# Altium project Power_Board.PrjPcb
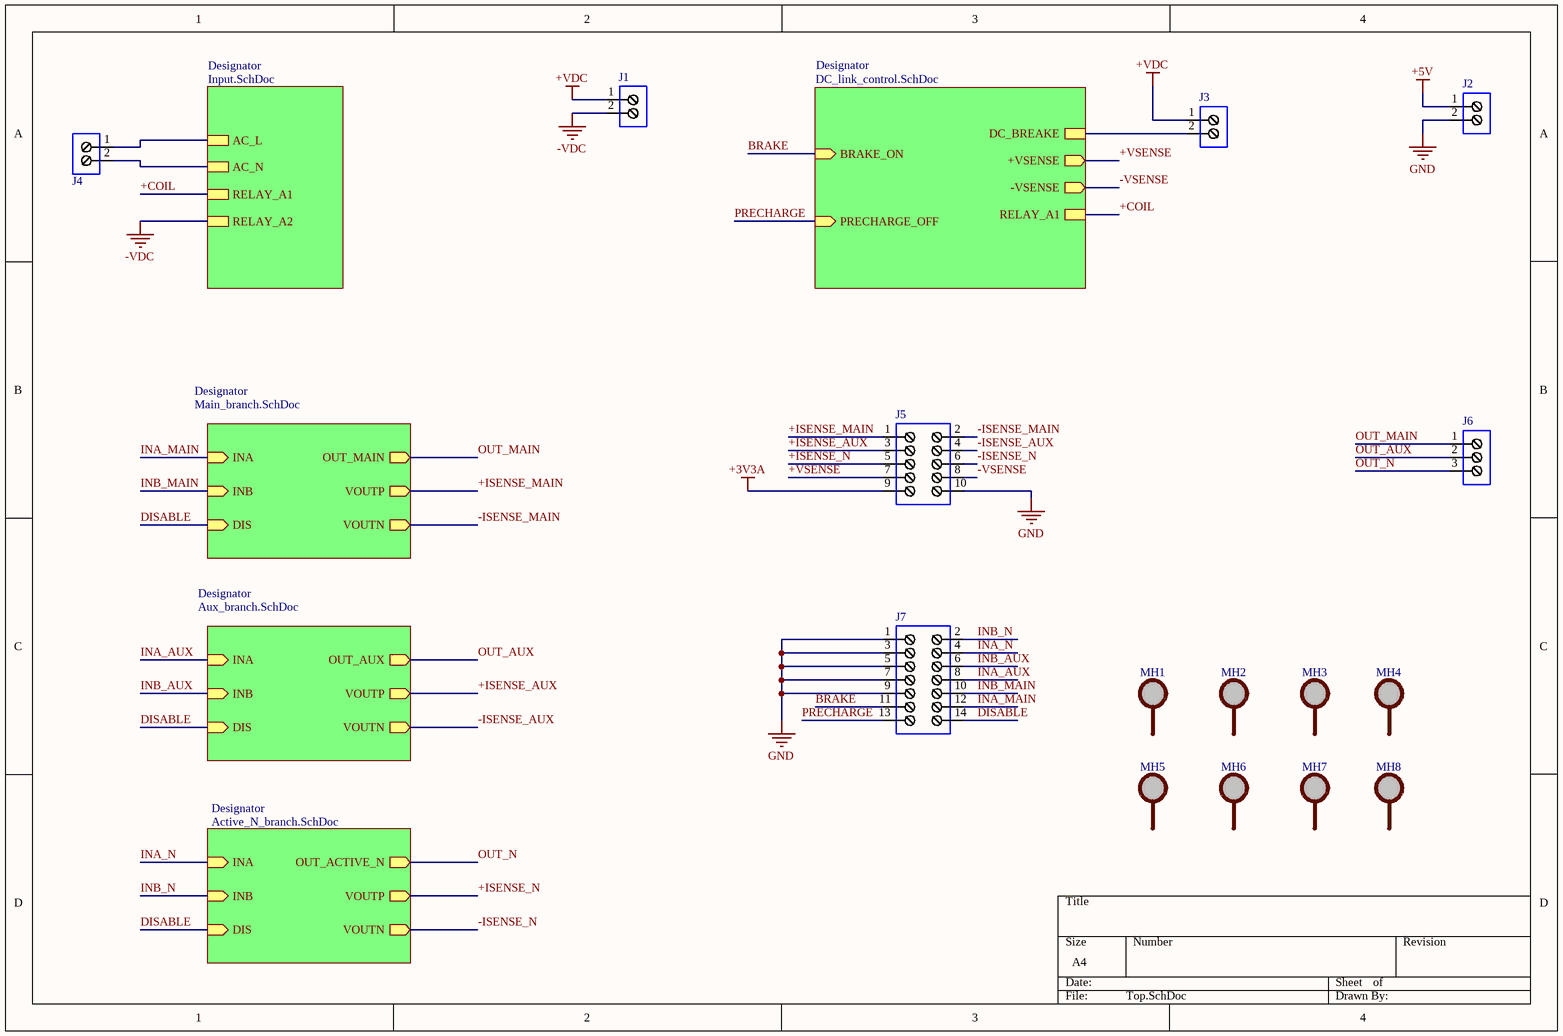
[diagram p0: Top.SchDoc]
6 sheets, 209 parts. Net scope: hierarchical (ports join the sheet entries above them; power ports are global).
Board file: Power_Board.PcbDoc
Sheets:
  Top.SchDoc
    Designator = Main_branch.SchDoc
    Designator = DC_link_control.SchDoc
    Designator = Aux_branch.SchDoc
    Designator = Input.SchDoc
    Designator = Active_N_branch.SchDoc

## Sheet Top.SchDoc
size A4; SheetNumber: 1; SheetTotal: 6

### Parts
J1  MKDSN1.5/2  [1729018]  (value not drawn)
J2  JST_B2B-XH-A_(LF)(SN)  [JST_B2B-XH-A_(LF)(SN)]  (value not drawn)
J3  MKDSN1.5/2  [1729018]  (value not drawn)
J4  MKDSN1.5/2  [1729018]  (value not drawn)
J5  DS1013-10SSIB1-B-0  [DS1013-10SSIB1-B-0]  (value not drawn)
J6  MKDSN 1,5/ 3-5,08  [1729131]  (value not drawn)
J7  DS1013-14SSIBG  [DS1013-14SSIBG]  (value not drawn)
MH1  Mounting Hole  [M3 mounting hole]  (value not drawn)
MH2  Mounting Hole  [M3 mounting hole]  (value not drawn)
MH3  Mounting Hole  [M3 mounting hole]  (value not drawn)
MH4  Mounting Hole  [M3 mounting hole]  (value not drawn)
MH5  Mounting Hole  [M3 mounting hole]  (value not drawn)
MH6  Mounting Hole  [M3 mounting hole]  (value not drawn)
MH7  Mounting Hole  [M3 mounting hole]  (value not drawn)
MH8  Mounting Hole  [M3 mounting hole]  (value not drawn)

### Sub-sheets
Designator = Main_branch.SchDoc: OUT_MAIN (out), VOUTP (out), VOUTN (out), INB (in), INA (in), DIS (in)
Designator = DC_link_control.SchDoc: DC_BREAKE, +VSENSE (out), -VSENSE (out), BRAKE_ON (in), PRECHARGE_OFF (in), RELAY_A1
Designator = Aux_branch.SchDoc: INB (in), INA (in), DIS (in), OUT_AUX (out), VOUTP (out), VOUTN (out)
Designator = Input.SchDoc: AC_L, AC_N, RELAY_A2, RELAY_A1
Designator = Active_N_branch.SchDoc: INB (in), INA (in), DIS (in), OUT_ACTIVE_N (out), VOUTP (out), VOUTN (out)

### Nets
+3V3A: J5.9
+5V: J2.1
+VDC: J1.1 J3.1
-VDC: J1.2 ; sheet Designator/RELAY_A2
GND: J2.2 J5.10 J7.1 J7.3 J7.5 J7.7 J7.9
+COIL: sheet Designator/RELAY_A1, sheet Designator/RELAY_A1
+ISENSE_AUX: J5.3 ; sheet Designator/VOUTP
+ISENSE_MAIN: J5.1 ; sheet Designator/VOUTP
+ISENSE_N: J5.5 ; sheet Designator/VOUTP
+VSENSE: J5.7 ; sheet Designator/+VSENSE
-ISENSE_AUX: J5.4 ; sheet Designator/VOUTN
-ISENSE_MAIN: J5.2 ; sheet Designator/VOUTN
-ISENSE_N: J5.6 ; sheet Designator/VOUTN
-VSENSE: J5.8 ; sheet Designator/-VSENSE
AC_N: J4.2 ; sheet Designator/AC_N
BRAKE: J7.11 ; sheet Designator/BRAKE_ON
DISABLE: J7.14 ; sheet Designator/DIS, sheet Designator/DIS, sheet Designator/DIS
INA_AUX: J7.8 ; sheet Designator/INA
INA_MAIN: J7.12 ; sheet Designator/INA
INA_N: J7.4 ; sheet Designator/INA
INB_AUX: J7.6 ; sheet Designator/INB
INB_MAIN: J7.10 ; sheet Designator/INB
INB_N: J7.2 ; sheet Designator/INB
OUT_AUX: J6.2 ; sheet Designator/OUT_AUX
OUT_MAIN: J6.1 ; sheet Designator/OUT_MAIN
OUT_N: J6.3 ; sheet Designator/OUT_ACTIVE_N
PRECHARGE: J7.13 ; sheet Designator/PRECHARGE_OFF
NetF1_1: J4.1 ; sheet Designator/AC_L
NetJ3_2: J3.2 ; sheet Designator/DC_BREAKE

### Library data of the parts
J1 J3 J4 = 1729018: Connector: PCB terminal block; 17.5A; 400V; PIN: 2; screw terminal
J2 = JST_B2B-XH-A_(LF)(SN): Connector: wire-board; XH; socket; male; data; 3A; 250V; PIN: 2; 2.5mm
J5 = DS1013-10SSIB1-B-0: Connector: IDC; socket; male; PIN: 10; straight; THT; 2.54mm; 2x5
J6 = 1729131: Connector: PCB terminal block; 17.5A; 400V; PIN: 3; screw terminal
J7 = DS1013-14SSIBG: Connector: IDC; socket; male; data; PIN: 14; straight; THT; 2.54mm
MH1-MH8 = M3_mounting_hole

## Sheet Main_branch.SchDoc
size A4; SheetNumber: 2; SheetTotal: 6
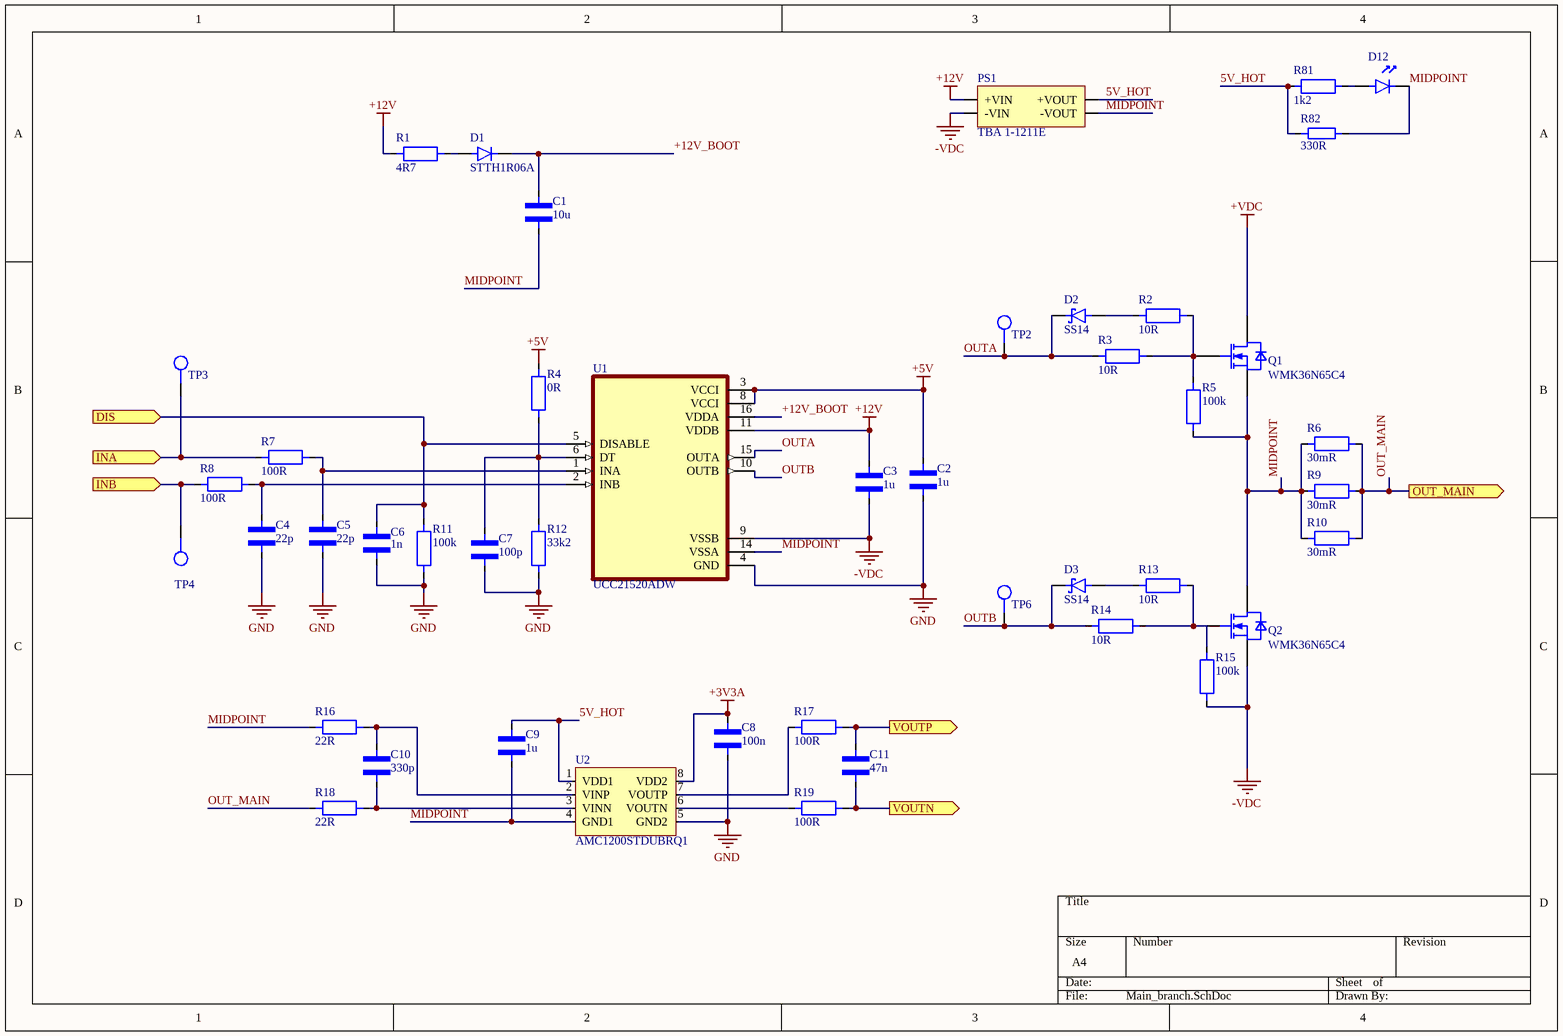
[diagram p1: Main_branch.SchDoc]

### Parts
C1  10u  [CAPACITOR_1206]
C2  1u  [Capacitor_0805]
C3  1u  [Capacitor_0805]
C4  22p  [Capacitor_0805]
C5  22p  [Capacitor_0805]
C6  1n  [Capacitor_0805]
C7  100p  [Capacitor_0805]
C8  100n  [Capacitor_0805]
C9  1u  [Capacitor_0805]
C10  330p  [Capacitor_0805]
C11  47n  [Capacitor_0805]
D1  STTH1R06A  [STTH1R06A]
D2  SS14  [DIOM5226X230N]
D3  SS14  [DIOM5226X230N]
D12  LTST-C171KRKT  [LTST-C171K]  (value not drawn)
PS1  TBA 1-1211E  [TBA 1-1211E]
Q1  WMK36N65C4  [TO220-3]
Q2  WMK36N65C4  [TO220-3]
R1  4R7  [RESISTOR_1206]
R2  10R  [RESISTOR_0805]
R3  10R  [RESISTOR_0805]
R4  0R  [RESISTOR_0805]
R5  100k  [RESISTOR_0805]
R6  30mR  [MAR251203FR030S]
R7  100R  [RESISTOR_0805]
R8  100R  [RESISTOR_0805]
R9  30mR  [MAR251203FR030S]
R10  30mR  [MAR251203FR030S]
R11  100k  [RESISTOR_0805]
R12  33k2  [RESISTOR_0805]
R13  10R  [RESISTOR_0805]
R14  10R  [RESISTOR_0805]
R15  100k  [RESISTOR_0805]
R16  22R  [RESISTOR_0805]
R17  100R  [RESISTOR_0805]
R18  22R  [RESISTOR_0805]
R19  100R  [RESISTOR_0805]
R81  1k2  [RESISTOR_0805]
R82  330R  [RESISTOR_1206]
TP2  TestPoint  [TestPoint_1.5mm]  (value not drawn)
TP3  TestPoint  [TestPoint_1.5mm]  (value not drawn)
TP4  TestPoint  [TestPoint_1.5mm]  (value not drawn)
TP6  TestPoint  [TestPoint_1.5mm]  (value not drawn)
U1  UCC21520ADW  [UCC21520ADW]
U2  AMC1200STDUBRQ1  [SOP254P1040X485-8N]

### Ports
DIS (in), INA (in), INB (in), OUT_MAIN (out), VOUTN (out), VOUTP (out)

### Nets
+3V3A: C8.2 U2.8(VDD2)
+5V: C2.1 R4.2 U1.3(VCCI) U1.8(VCCI)
+12V: C3.2 PS1.1(+VIN) R1.1 U1.11(VDDB)
+VDC: Q1.2(DRAIN)
-VDC: C3.1 PS1.2(-VIN) Q2.3(SOURCE) R15.1 U1.9(VSSB)
GND: C2.2 C4.1 C5.1 C6.1 C7.1 C8.1 R11.1 R12.1 U1.4(GND) U2.5(GND2)
5V_HOT: C9.2 PS1.4(+VOUT) R81.1 R82.1 U2.1(VDD1)  [project net 5V_HOT_2]
+12V_BOOT: C1.1 D1.2(K) U1.16(VDDA)  [project net +12V_BOOT_2]
+ISENSE_MAIN: C11.2 R17.2 ; port VOUTP
-ISENSE_MAIN: C11.1 R19.2 ; port VOUTN
DISABLE: C6.2 R11.2 U1.5(DISABLE) ; port DIS
INA_MAIN: R7.1 TP3.1 ; port INA
INB_MAIN: R8.1 TP4.1 ; port INB
MIDPOINT: C1.2 C9.1 D12.2(K) PS1.3(-VOUT) Q1.3(SOURCE) Q2.2(DRAIN) R5.1 R6.1 R9.1 R10.1 R16.1 R82.2 U1.14(VSSA) U2.4(GND1)  [project net MIDPOINT_2]
OUT_MAIN: R6.2 R9.2 R10.2 R18.1 ; port OUT_MAIN
OUTA: D2.2(K) R3.1 TP2.1 U1.15(OUTA)  [project net OUTA_2]
OUTB: D3.2(K) R14.1 TP6.1 U1.10(OUTB)  [project net OUTB_2]
NetC4_2: C4.2 R8.2 U1.2(INB)
NetC5_2: C5.2 R7.2 U1.1(INA)
NetC7_2: C7.2 R4.1 R12.2 U1.6(DT)
NetC10_1: C10.1 R18.2 U2.3(VINN)
NetC10_2: C10.2 R16.2 U2.2(VINP)
NetD1_1: D1.1(A) R1.2
NetD2_1: D2.1(A) R2.1
NetD3_1: D3.1(A) R13.1
NetD12_1: D12.1(A) R81.2
NetQ1_1: Q1.1(GATE) R2.2 R3.2 R5.2
NetQ2_1: Q2.1(GATE) R13.2 R14.2 R15.2
NetR17_1: R17.1 U2.7(VOUTP)
NetR19_1: R19.1 U2.6(VOUTN)

### Library data of the parts
C1 = CAPACITOR_1206: MLCC capacitor in 1206 package
C2-C11 = CAPACITOR_0805: MLCC capacitor in 0805 package
D1 = STTH1R06A: Diode: rectifying; SMD; 600V; 1A; 25ns; SMA; Ufmax: 1V; Ifsm: 20A
D2 D3 = SS14: 1A, 40V, Schottky Rectifier; MF: Taiwan Semiconductor; SnapEDA_Link: https://www.snapeda.com/parts/SS14/taiwan/view-part/?ref=snap; Package: SMA-2 Taiwan Semiconductor; MP: SS14; Check_prices: https://www.snapeda.com/parts/SS14/taiwan/view-part/?ref=eda
D12 = LTST-C171KRKT: LED; red; SMD; 0805; 18÷54mcd; 2÷2.4VDC; 2x1.25x0.8mm; 130°; 20mA
PS1 = TBA 1-1211E: Converter: DC/DC; 1W; Uin: 10.8÷13.2VDC; Uout: 5VDC; Iout: 200mA; pin to pad: 3>4 4>6
Q1 Q2 = WMK36N65C4: Transistor: N-MOSFET; WMOS™ C4; unipolar; 650V; 20A; Idm: 100A; 277W; Manufacturer: WAYON; ManufacturerPartNumber: WMK36N65C4; PackageReference: PG-TO220
R1 R82 = RESISTOR_1206: SMD resistor in 1206 package
R2-R5 R7 R8 R13-R19 R81 = RESISTOR_0805: SMD resistor in 0805 package
  R7: Value: 100R
R6 R9 R10 = MAR251203FR030S: Resistor: thick film; 30mΩ; sensing; SMD; 2512; 3W; ±1%; -55÷170°C; Manufacturer: Wayon; Value: 30mR; ComponentLink1Description: TME; ComponentLink1URL: https://www.tme.eu/pl/details/mar251203fr010s/rezystory-smd/wayon/; Power: 3W; Tolerance: 1%
R11 R12 = RESISTOR_0805: SMD resistor in 0805 package; Value: 100R
U1 = UCC21520ADW: 5.7kVrms, 4A/6A dual-channel isolated gate driver w/ dual input, disable pin, 8V UVLO in DW package; MF: Texas Instruments; SnapEDA_Link: https://www.snapeda.com/parts/UCC21520ADW/Texas+Instruments/view-part/?ref=snap; Package: SOIC-16 Texas Instruments; Value: *; MP: UCC21520ADW; Check_prices: https://www.snapeda.com/parts/UCC21520ADW/Texas+Instruments/view-part/?ref=eda
U2 = AMC1200: AMC1200/B Fully-Differential Isolation Amplifier; Manufacturer: Texas Instruments

## Sheet DC_link_control.SchDoc
size A4; SheetNumber: 6; SheetTotal: 6
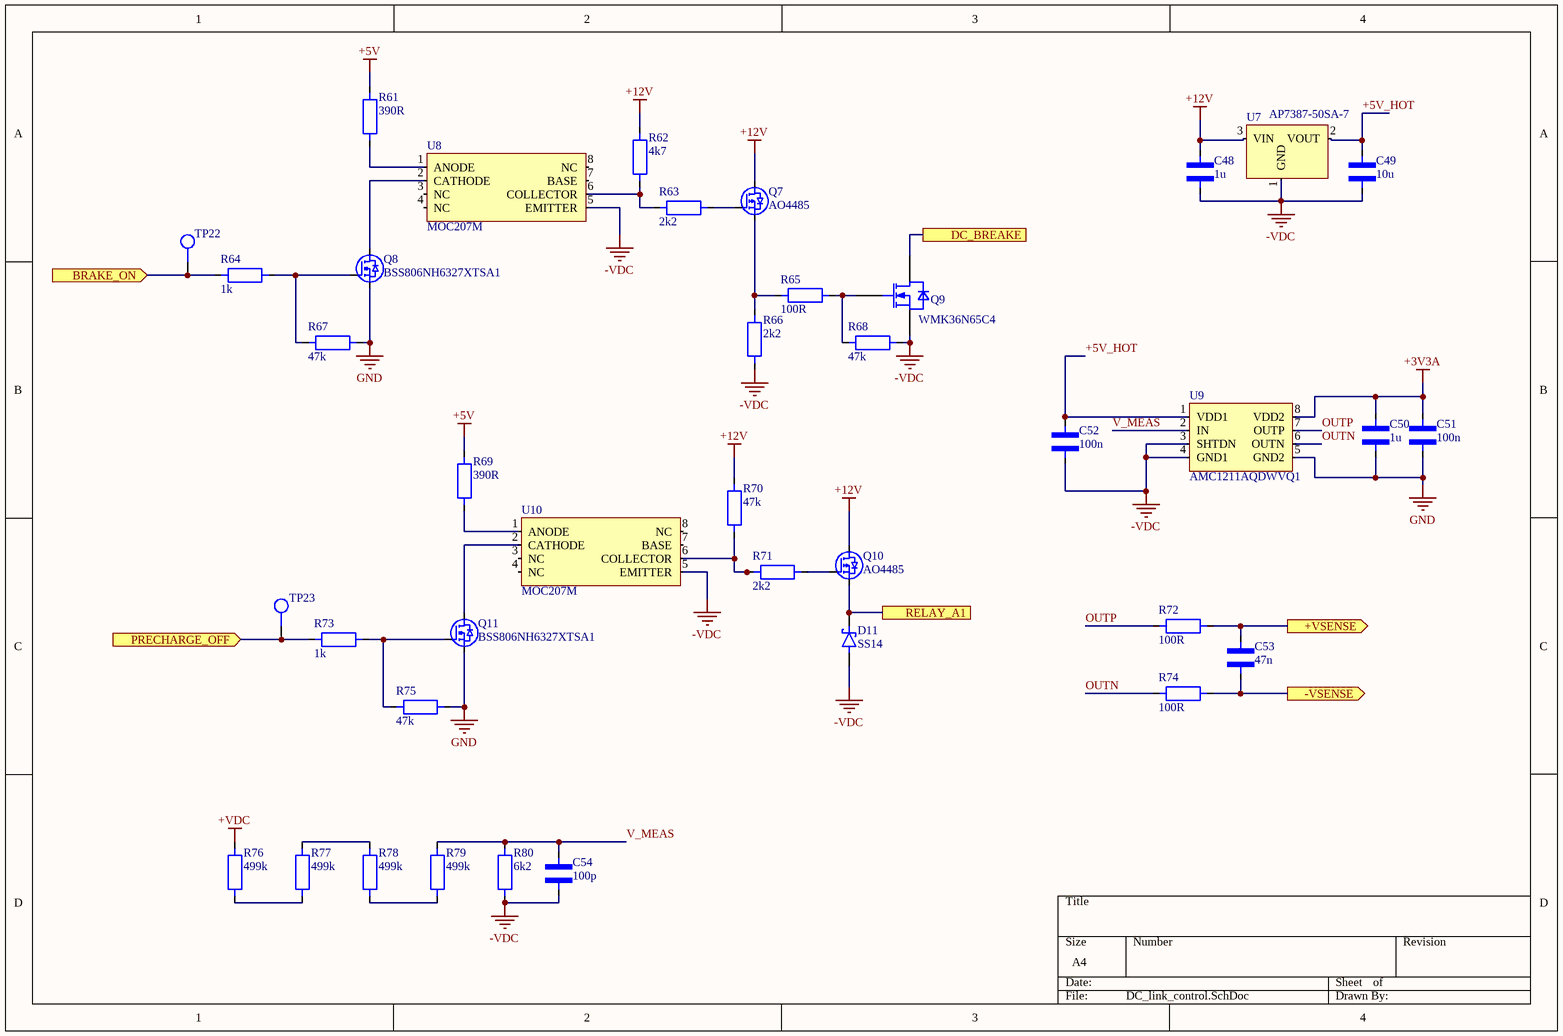
[diagram p2: DC_link_control.SchDoc]

### Parts
C48  1u  [Capacitor_0805]
C49  10u  [Capacitor_0805]
C50  1u  [Capacitor_0805]
C51  100n  [Capacitor_0805]
C52  100n  [Capacitor_0805]
C53  47n  [Capacitor_0805]
C54  100p  [Capacitor_0805]
D11  SS14  [DIOM5226X230N]
Q7  AO4485  [AO4485]
Q8  BSS806NH6327XTSA1  [BSS806NH6327XTSA1]
Q9  WMK36N65C4  [TO220-3]
Q10  AO4485  [AO4485]
Q11  BSS806NH6327XTSA1  [BSS806NH6327XTSA1]
R61  390R  [RESISTOR_0805]
R62  4k7  [RESISTOR_0805]
R63  2k2  [RESISTOR_0805]
R64  1k  [RESISTOR_0805]
R65  100R  [RESISTOR_0805]
R66  2k2  [RESISTOR_0805]
R67  47k  [RESISTOR_0805]
R68  47k  [RESISTOR_0805]
R69  390R  [RESISTOR_0805]
R70  47k  [RESISTOR_0805]
R71  2k2  [RESISTOR_0805]
R72  100R  [RESISTOR_0805]
R73  1k  [RESISTOR_0805]
R74  100R  [RESISTOR_0805]
R75  47k  [RESISTOR_0805]
R76  499k  [RESISTOR_1206]
R77  499k  [RESISTOR_1206]
R78  499k  [RESISTOR_1206]
R79  499k  [RESISTOR_1206]
R80  6k2  [RESISTOR_0805]
TP22  TestPoint  [TestPoint_1.5mm]  (value not drawn)
TP23  TestPoint  [TestPoint_1.5mm]  (value not drawn)
U7  AP7387-50SA-7  [SOT90P240X110-3N]
U8  MOC207M  [SOIC127P590X363-8N]
U9  AMC1211AQDWVQ1  [SOIC127P1150X275-8N]
U10  MOC207M  [SOIC127P590X363-8N]

### Ports
+VSENSE (out), -VSENSE (out), BRAKE_ON (in), DC_BREAKE, PRECHARGE_OFF (in), RELAY_A1

### Nets
+3V3A: C50.2 C51.2 U9.8(VDD2)
+5V: R61.2 R69.2
+12V: C48.2 Q7.2(D) Q10.2(D) R62.2 R70.2 U7.3(VIN)
+VDC: R76.2
-VDC: C48.1 C49.1 C52.1 C54.1 D11.1(A) Q9.3(SOURCE) R66.2 R68.2 R80.1 U7.1(GND) U8.5(EMITTER) U9.3(SHTDN) U9.4(GND1) U10.5(EMITTER)
GND: C50.1 C51.1 Q8.3(S) Q11.3(S) R67.1 R75.1 U9.5(GND2)
+5V_HOT: C49.2 C52.2 U7.2(VOUT) U9.1(VDD1)  [project net +5V_HOT_6]
+COIL: D11.2(K) Q10.3(S) ; port RELAY_A1
+VSENSE: C53.2 R72.2 ; port +VSENSE
-VSENSE: C53.1 R74.2 ; port -VSENSE
BRAKE: R64.1 TP22.1 ; port BRAKE_ON
OUTN: R74.1 U9.6(OUTN)  [project net OUTN_6]
OUTP: R72.1 U9.7(OUTP)  [project net OUTP_6]
PRECHARGE: R73.1 TP23.1 ; port PRECHARGE_OFF
V_MEAS: C54.2 R79.2 R80.2 U9.2(IN)  [project net V_MEAS_6]
NetJ3_2: Q9.2(DRAIN) ; port DC_BREAKE
NetQ7_1: Q7.1(G) R63.1
NetQ7_3: Q7.3(S) R65.2 R66.1
NetQ8_1: Q8.1(G) R64.2 R67.2
NetQ8_2: Q8.2(D) U8.2(CATHODE)
NetQ9_1: Q9.1(GATE) R65.1 R68.1
NetQ10_1: Q10.1(G) R71.1
NetQ11_1: Q11.1(G) R73.2 R75.2
NetQ11_2: Q11.2(D) U10.2(CATHODE)
NetR61_1: R61.1 U8.1(ANODE)
NetR62_1: R62.1 R63.2 U8.6(COLLECTOR)
NetR69_1: R69.1 U10.1(ANODE)
NetR70_1: R70.1 R71.2 U10.6(COLLECTOR)
NetR76_1: R76.1 R77.1
NetR77_2: R77.2 R78.2
NetR78_1: R78.1 R79.1

Not connected (* = marked no-connect by the designer): U8 3(NC) 4(NC) 7(BASE) 8(NC); U10 3(NC) 4(NC) 7(BASE) 8(NC)

### Library data of the parts
C48-C54 = CAPACITOR_0805: MLCC capacitor in 0805 package
D11 = SS14: as D2 on sheet Main_branch; SnapEDA_Link: https://www.snapeda.com/parts/SS14/taiwan/view-part/?ref=snap; Package: SMA-2 Taiwan Semiconductor; MP: SS14; Check_prices: https://www.snapeda.com/parts/SS14/taiwan/view-part/?ref=eda
Q7 Q10 = AO4485: Transistor: P-MOSFET; unipolar; -40V; -8A; 1.1W; SO8; pin to pad: 1>4 2>5+6+7+8 3>1+2+3
Q8 Q11 = BSS806NH6327XTSA1: Transistor: N-MOSFET; unipolar; 20V; 2.3A; 0.5W; SOT23
Q9 = WMK36N65C4: as Q1 on sheet Main_branch; ManufacturerPartNumber: WMK36N65C4; PackageReference: PG-TO220
R61-R75 = RESISTOR_0805: SMD resistor in 0805 package
R76-R79 = RESISTOR_1206: SMD resistor in 1206 package
R80 = RESISTOR_0805: SMD resistor in 0805 package; Tolerance: 0,1%
U7 = AP7387: WIDE INPUT VOLTAGE RANGE, 150mA ULDO REGULATOR; Manufacturer: Diodes Incorporated; Vout: 5V; Iout: 150mA
U8 U10 = MOC207M: 8-pin SOIC Single-Channel Phototransistor Output Optocoupler; Manufacturer: ONSEMI/Fairchild; Isolation voltage: 2,5kV; CTR: 100-200%; Vce: 30V; ton: 3,2us; toff: 4,7us
U9 = AMC1211: AMC1211-Q1 Automotive, High-Impedance, 2-V Input, Basic Isolated Amplifier; Manufacturer: Texas Instruments

## Sheet Aux_branch.SchDoc
size A4; SheetNumber: 4; SheetTotal: 6
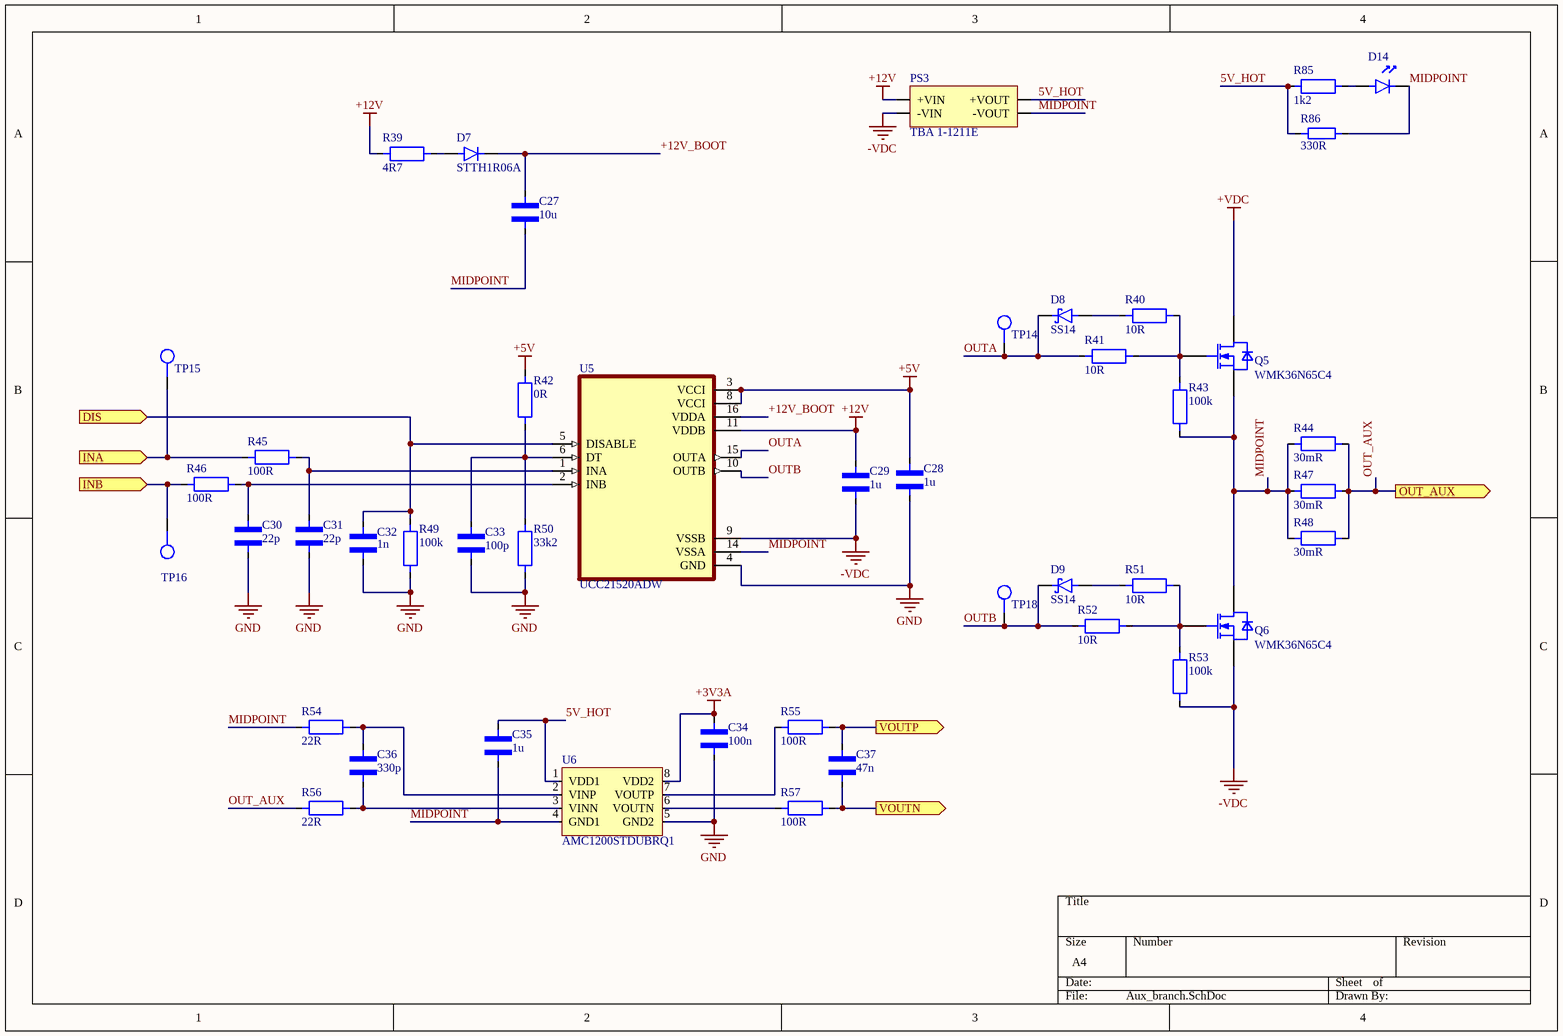
[diagram p3: Aux_branch.SchDoc]

### Parts
C27  10u  [CAPACITOR_1206]
C28  1u  [Capacitor_0805]
C29  1u  [Capacitor_0805]
C30  22p  [Capacitor_0805]
C31  22p  [Capacitor_0805]
C32  1n  [Capacitor_0805]
C33  100p  [Capacitor_0805]
C34  100n  [Capacitor_0805]
C35  1u  [Capacitor_0805]
C36  330p  [Capacitor_0805]
C37  47n  [Capacitor_0805]
D7  STTH1R06A  [STTH1R06A]
D8  SS14  [DIOM5226X230N]
D9  SS14  [DIOM5226X230N]
D14  LTST-C171KRKT  [LTST-C171K]  (value not drawn)
PS3  TBA 1-1211E  [TBA 1-1211E]
Q5  WMK36N65C4  [TO220-3]
Q6  WMK36N65C4  [TO220-3]
R39  4R7  [RESISTOR_1206]
R40  10R  [RESISTOR_0805]
R41  10R  [RESISTOR_0805]
R42  0R  [RESISTOR_0805]
R43  100k  [RESISTOR_0805]
R44  30mR  [MAR251203FR030S]
R45  100R  [RESISTOR_0805]
R46  100R  [RESISTOR_0805]
R47  30mR  [MAR251203FR030S]
R48  30mR  [MAR251203FR030S]
R49  100k  [RESISTOR_0805]
R50  33k2  [RESISTOR_0805]
R51  10R  [RESISTOR_0805]
R52  10R  [RESISTOR_0805]
R53  100k  [RESISTOR_0805]
R54  22R  [RESISTOR_0805]
R55  100R  [RESISTOR_0805]
R56  22R  [RESISTOR_0805]
R57  100R  [RESISTOR_0805]
R85  1k2  [RESISTOR_0805]
R86  330R  [RESISTOR_1206]
TP14  TestPoint  [TestPoint_1.5mm]  (value not drawn)
TP15  TestPoint  [TestPoint_1.5mm]  (value not drawn)
TP16  TestPoint  [TestPoint_1.5mm]  (value not drawn)
TP18  TestPoint  [TestPoint_1.5mm]  (value not drawn)
U5  UCC21520ADW  [UCC21520ADW]
U6  AMC1200STDUBRQ1  [SOP254P1040X485-8N]

### Ports
DIS (in), INA (in), INB (in), OUT_AUX (out), VOUTN (out), VOUTP (out)

### Nets
+3V3A: C34.2 U6.8(VDD2)
+5V: C28.1 R42.2 U5.3(VCCI) U5.8(VCCI)
+12V: C29.2 PS3.1(+VIN) R39.1 U5.11(VDDB)
+VDC: Q5.2(DRAIN)
-VDC: C29.1 PS3.2(-VIN) Q6.3(SOURCE) R53.1 U5.9(VSSB)
GND: C28.2 C30.1 C31.1 C32.1 C33.1 C34.1 R49.1 R50.1 U5.4(GND) U6.5(GND2)
5V_HOT: C35.2 PS3.4(+VOUT) R85.1 R86.1 U6.1(VDD1)  [project net 5V_HOT_4]
+12V_BOOT: C27.1 D7.2(K) U5.16(VDDA)  [project net +12V_BOOT_4]
+ISENSE_AUX: C37.2 R55.2 ; port VOUTP
-ISENSE_AUX: C37.1 R57.2 ; port VOUTN
DISABLE: C32.2 R49.2 U5.5(DISABLE) ; port DIS
INA_AUX: R45.1 TP15.1 ; port INA
INB_AUX: R46.1 TP16.1 ; port INB
MIDPOINT: C27.2 C35.1 D14.2(K) PS3.3(-VOUT) Q5.3(SOURCE) Q6.2(DRAIN) R43.1 R44.1 R47.1 R48.1 R54.1 R86.2 U5.14(VSSA) U6.4(GND1)  [project net MIDPOINT_4]
OUT_AUX: R44.2 R47.2 R48.2 R56.1 ; port OUT_AUX
OUTA: D8.2(K) R41.1 TP14.1 U5.15(OUTA)  [project net OUTA_4]
OUTB: D9.2(K) R52.1 TP18.1 U5.10(OUTB)  [project net OUTB_4]
NetC30_2: C30.2 R46.2 U5.2(INB)
NetC31_2: C31.2 R45.2 U5.1(INA)
NetC33_2: C33.2 R42.1 R50.2 U5.6(DT)
NetC36_1: C36.1 R56.2 U6.3(VINN)
NetC36_2: C36.2 R54.2 U6.2(VINP)
NetD7_1: D7.1(A) R39.2
NetD8_1: D8.1(A) R40.1
NetD9_1: D9.1(A) R51.1
NetD14_1: D14.1(A) R85.2
NetQ5_1: Q5.1(GATE) R40.2 R41.2 R43.2
NetQ6_1: Q6.1(GATE) R51.2 R52.2 R53.2
NetR55_1: R55.1 U6.7(VOUTP)
NetR57_1: R57.1 U6.6(VOUTN)

### Library data of the parts
C27 = CAPACITOR_1206: MLCC capacitor in 1206 package
C28-C37 = CAPACITOR_0805: MLCC capacitor in 0805 package
D7 = STTH1R06A: as D1 on sheet Main_branch
D8 D9 = SS14: as D2 on sheet Main_branch; SnapEDA_Link: https://www.snapeda.com/parts/SS14/taiwan/view-part/?ref=snap; Package: SMA-2 Taiwan Semiconductor; MP: SS14; Check_prices: https://www.snapeda.com/parts/SS14/taiwan/view-part/?ref=eda
D14 = LTST-C171KRKT: as D12 on sheet Main_branch
PS3 = TBA 1-1211E: Converter: DC/DC; 1W; Uin: 10.8÷13.2VDC; Uout: 5VDC; Iout: 200mA; pin to pad: 3>4 4>6
Q5 Q6 = WMK36N65C4: as Q1 on sheet Main_branch; ManufacturerPartNumber: WMK36N65C4; PackageReference: PG-TO220
R39 R86 = RESISTOR_1206: SMD resistor in 1206 package
R40-R43 R45 R46 R51-R57 R85 = RESISTOR_0805: SMD resistor in 0805 package
  R45: Value: 100R
R44 R47 R48 = MAR251203FR030S: as R6 on sheet Main_branch; Value: 30mR; ComponentLink1Description: TME; ComponentLink1URL: https://www.tme.eu/pl/details/mar251203fr010s/rezystory-smd/wayon/; Power: 3W; Tolerance: 1%
R49 R50 = RESISTOR_0805: as R11 on sheet Main_branch
U5 = UCC21520ADW: as U1 on sheet Main_branch; SnapEDA_Link: https://www.snapeda.com/parts/UCC21520ADW/Texas+Instruments/view-part/?ref=snap; Package: SOIC-16 Texas Instruments; Value: *; MP: UCC21520ADW; Check_prices: https://www.snapeda.com/parts/UCC21520ADW/Texas+Instruments/view-part/?ref=eda
U6 = AMC1200: as U2 on sheet Main_branch

## Sheet Input.SchDoc
size A4; SheetNumber: 5; SheetTotal: 6
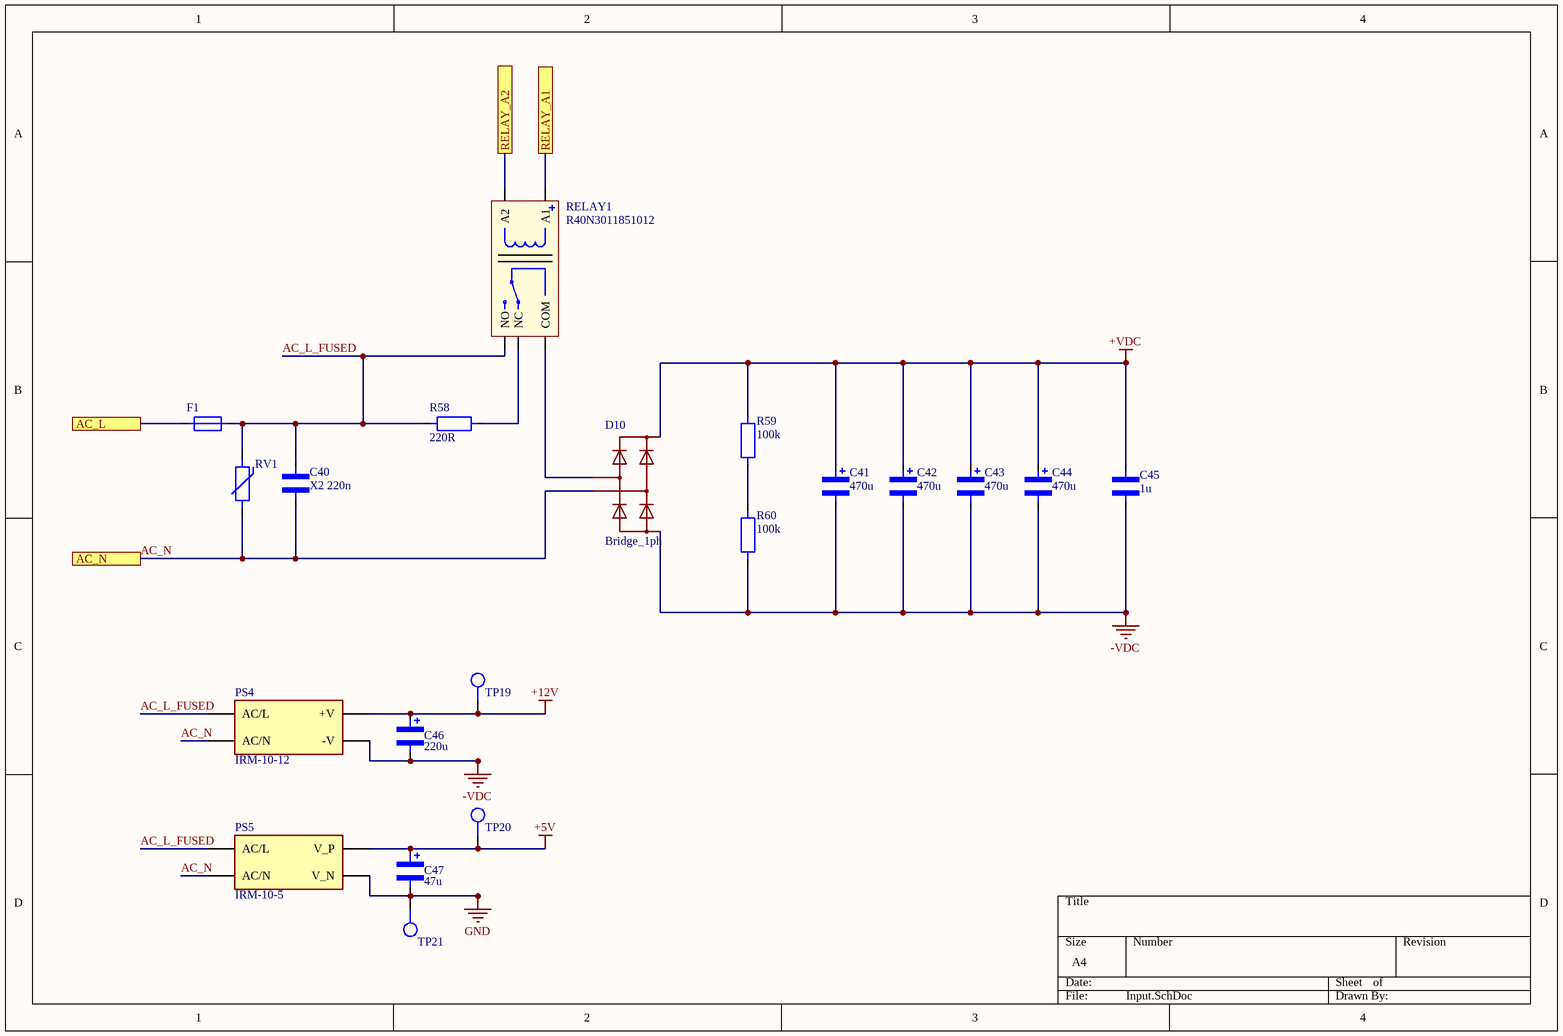
[diagram p4: Input.SchDoc]

### Parts
C40  X2 220n  [R46KN322000M1K]
C41  470u  [HF2G477M35040HC]
C42  470u  [HF2G477M35040HC]
C43  470u  [HF2G477M35040HC]
C44  470u  [HF2G477M35040HC]
C45  1u  [MPP-1UR20/630]
C46  220u  [EEUFR1V221]
C47  47u  [RD1C476M05011BB]
D10  Bridge_1ph  [KBPCxxxxFP]
F1  Fuse clips  [0751.0056]  (value not drawn)
PS4  IRM-10-12  [CONV_IRM-10-12]
PS5  IRM-10-5  [CONV_IRM-10-5]
R58  220R  [CRL30W-220R]
R59  100k  [RESISTOR_2512]
R60  100k  [RESISTOR_2512]
RELAY1  R40N3011851012  [R40N3011851012]
RV1  B72220S0271K101  [B72220S0271K101]  (value not drawn)
TP19  TestPoint  [TestPoint_1.5mm]  (value not drawn)
TP20  TestPoint  [TestPoint_1.5mm]  (value not drawn)
TP21  TestPoint  [TestPoint_1.5mm]  (value not drawn)

### Ports
AC_L, AC_N, RELAY_A1, RELAY_A2

### Nets
+5V: C47.2 PS5.4(V_P) TP20.1
+12V: C46.2 PS4.+V TP19.1
+VDC: C41.2 C42.2 C43.2 C44.2 C45.2 D10.1(+) R59.2
-VDC: C41.1 C42.1 C43.1 C44.1 C45.1 C46.1 D10.3(-) PS4.-V R60.1 RELAY1.A2 ; port RELAY_A2
GND: C47.1 PS5.3(V_N) TP21.1
+COIL: RELAY1.A1 ; port RELAY_A1
AC_L_FUSED: C40.2 F1.2 PS4.AC_L(AC/L) PS5.2(AC/L) R58.1 RELAY1.NO RV1.2  [project net AC_L_FUSED_5]
AC_N: C40.1 D10.4(Input_~) PS4.AC_N(AC/N) PS5.1(AC/N) RV1.1 ; port AC_N
NetD10_2: D10.2(Input_~) RELAY1.COM
NetF1_1: F1.1 ; port AC_L
NetR58_2: R58.2 RELAY1.NC
NetR59_1: R59.1 R60.2

### Library data of the parts
C40 = R46KN322000M1K: Capacitor: polypropylene; X2; R46; 220nF; 560VDC; 275VAC; THT; ±10%
C41-C44 = HF2G477M35040HC: Capacitor: electrolytic; SNAP-IN; 470uF; 400VDC; Ø35x40mm; ±20%; Value: 470u
C45 = MPP-1UR20/630: Capacitor: polypropylene; 1uF; 630VDC; 22x23.7x15.7mm; THT; ±10%; Value: 1u
C46 = EEUFR1V221: Capacitor: electrolytic; low ESR; THT; 220uF; 35VDC; Ø8x11.5mm
C47 = RD1C476M05011BB: Capacitor: electrolytic; THT; 47uF; 16VDC; Ø5x11mm; Pitch: 2mm; ±20%
D10 = Bridge_1ph: ki_keywords: Bridge 1 phase; ki_description: Bridge_1_phase; Datasheet: https://diotec.com/de/produktliste/B1.html
F1 = 0751.0056: Fuse clips; cylindrical fuses; THT; 5x20mm,6.3x32mm; 16A; bronze; pin to pad: 1>1+2 2>3+4
PS4 = IRM-10-12: Power Supply,AC-DC,12V,0.85A,100-264V In,Encapsulated,Thru-Hole,IRM Series | MEAN WELL IRM-10-12; SnapEDA_Link: https://www.snapeda.com/parts/IRM-10-12/Mean+Well/view-part/?ref=snap; Package: None; Value: *; MF: MEAN WELL; MP: IRM-10-12; Check_prices: https://www.snapeda.com/parts/IRM-10-12/Mean+Well/view-part/?ref=eda
PS5 = IRM-10-5: Enclosed AC DC Converters 1 Output 5V - - - 2A 85 ~ 305 VAC, 120 ~ 430 VDC Input; MF: MEAN WELL; Value: *; Purchase-URL: https://pricing.snapeda.com/search/part/IRM-10-5/?ref=eda; Package: None; Check_prices: https://www.snapeda.com/parts/IRM-10-5/Mean+Well/view-part/?ref=eda; SnapEDA_Link: https://www.snapeda.com/parts/IRM-10-5/Mean+Well/view-part/?ref=snap; Price: None; Availability: In Stock; MP: IRM-10-5
R58 = CRL30W-220R: 30W 220Ω cement resistor; Manufacturer: SR PASSIVES; Tolerance: 5%; Power: 30W; Value: 220R
R59 R60 = RESISTOR_2512: SMD resistor in 2512 package; Value: *
RELAY1 = R40N3011851012: Relay: electromagnetic; Ucoil: 12VDC; SPDT; 40A; max.300VAC; R40N; Manufacturer: RELPOL
RV1 = B72220S0271K101: Varistor: metal-oxide; THT; 275VAC; 350VDC; 430V; 8000A; Ø22.5mm

## Sheet Active_N_branch.SchDoc
size A4; SheetNumber: 3; SheetTotal: 6
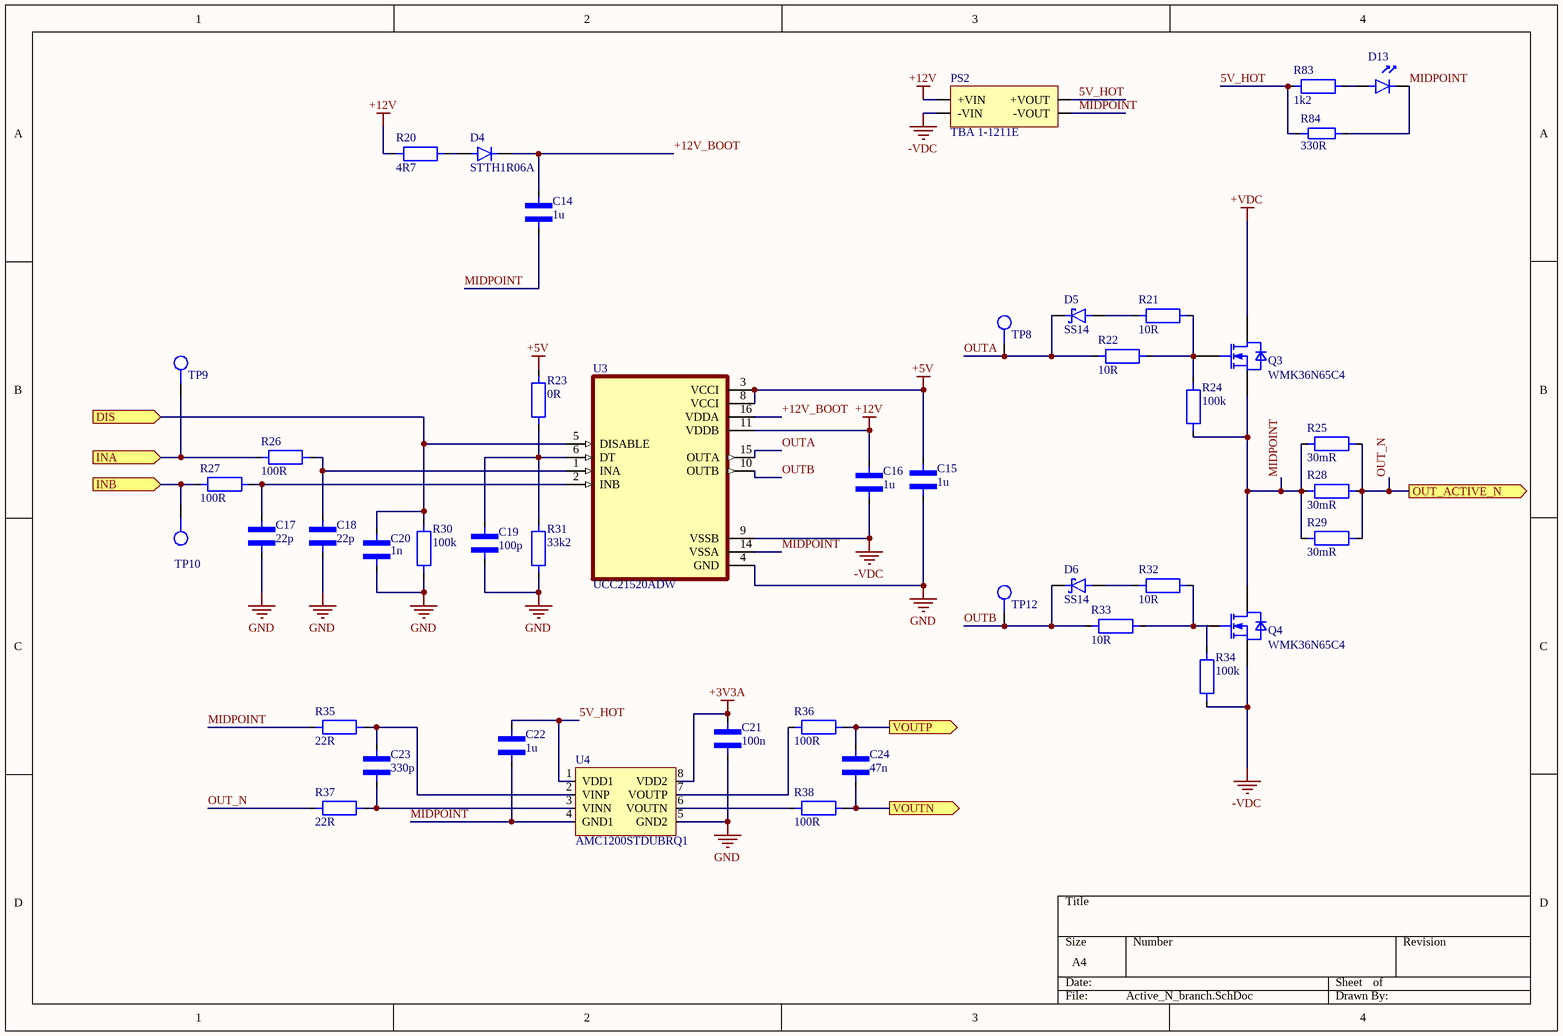
[diagram p5: Active_N_branch.SchDoc]

### Parts
C14  1u  [CAPACITOR_1206]
C15  1u  [Capacitor_0805]
C16  1u  [Capacitor_0805]
C17  22p  [Capacitor_0805]
C18  22p  [Capacitor_0805]
C19  100p  [Capacitor_0805]
C20  1n  [Capacitor_0805]
C21  100n  [Capacitor_0805]
C22  1u  [Capacitor_0805]
C23  330p  [Capacitor_0805]
C24  47n  [Capacitor_0805]
D4  STTH1R06A  [STTH1R06A]
D5  SS14  [DIOM5226X230N]
D6  SS14  [DIOM5226X230N]
D13  LTST-C171KRKT  [LTST-C171K]  (value not drawn)
PS2  TBA 1-1211E  [TBA 1-1211E]
Q3  WMK36N65C4  [TO220-3]
Q4  WMK36N65C4  [TO220-3]
R20  4R7  [RESISTOR_1206]
R21  10R  [RESISTOR_0805]
R22  10R  [RESISTOR_0805]
R23  0R  [RESISTOR_0805]
R24  100k  [RESISTOR_0805]
R25  30mR  [MAR251203FR030S]
R26  100R  [RESISTOR_0805]
R27  100R  [RESISTOR_0805]
R28  30mR  [MAR251203FR030S]
R29  30mR  [MAR251203FR030S]
R30  100k  [RESISTOR_0805]
R31  33k2  [RESISTOR_0805]
R32  10R  [RESISTOR_0805]
R33  10R  [RESISTOR_0805]
R34  100k  [RESISTOR_0805]
R35  22R  [RESISTOR_0805]
R36  100R  [RESISTOR_0805]
R37  22R  [RESISTOR_0805]
R38  100R  [RESISTOR_0805]
R83  1k2  [RESISTOR_0805]
R84  330R  [RESISTOR_1206]
TP8  TestPoint  [TestPoint_1.5mm]  (value not drawn)
TP9  TestPoint  [TestPoint_1.5mm]  (value not drawn)
TP10  TestPoint  [TestPoint_1.5mm]  (value not drawn)
TP12  TestPoint  [TestPoint_1.5mm]  (value not drawn)
U3  UCC21520ADW  [UCC21520ADW]
U4  AMC1200STDUBRQ1  [SOP254P1040X485-8N]

### Ports
DIS (in), INA (in), INB (in), OUT_ACTIVE_N (out), VOUTN (out), VOUTP (out)

### Nets
+3V3A: C21.2 U4.8(VDD2)
+5V: C15.1 R23.2 U3.3(VCCI) U3.8(VCCI)
+12V: C16.2 PS2.1(+VIN) R20.1 U3.11(VDDB)
+VDC: Q3.2(DRAIN)
-VDC: C16.1 PS2.2(-VIN) Q4.3(SOURCE) R34.1 U3.9(VSSB)
GND: C15.2 C17.1 C18.1 C19.1 C20.1 C21.1 R30.1 R31.1 U3.4(GND) U4.5(GND2)
5V_HOT: C22.2 PS2.4(+VOUT) R83.1 R84.1 U4.1(VDD1)  [project net 5V_HOT_3]
+12V_BOOT: C14.1 D4.2(K) U3.16(VDDA)  [project net +12V_BOOT_3]
+ISENSE_N: C24.2 R36.2 ; port VOUTP
-ISENSE_N: C24.1 R38.2 ; port VOUTN
DISABLE: C20.2 R30.2 U3.5(DISABLE) ; port DIS
INA_N: R26.1 TP9.1 ; port INA
INB_N: R27.1 TP10.1 ; port INB
MIDPOINT: C14.2 C22.1 D13.2(K) PS2.3(-VOUT) Q3.3(SOURCE) Q4.2(DRAIN) R24.1 R25.1 R28.1 R29.1 R35.1 R84.2 U3.14(VSSA) U4.4(GND1)  [project net MIDPOINT_3]
OUT_N: R25.2 R28.2 R29.2 R37.1 ; port OUT_ACTIVE_N
OUTA: D5.2(K) R22.1 TP8.1 U3.15(OUTA)  [project net OUTA_3]
OUTB: D6.2(K) R33.1 TP12.1 U3.10(OUTB)  [project net OUTB_3]
NetC17_2: C17.2 R27.2 U3.2(INB)
NetC18_2: C18.2 R26.2 U3.1(INA)
NetC19_2: C19.2 R23.1 R31.2 U3.6(DT)
NetC23_1: C23.1 R37.2 U4.3(VINN)
NetC23_2: C23.2 R35.2 U4.2(VINP)
NetD4_1: D4.1(A) R20.2
NetD5_1: D5.1(A) R21.1
NetD6_1: D6.1(A) R32.1
NetD13_1: D13.1(A) R83.2
NetQ3_1: Q3.1(GATE) R21.2 R22.2 R24.2
NetQ4_1: Q4.1(GATE) R32.2 R33.2 R34.2
NetR36_1: R36.1 U4.7(VOUTP)
NetR38_1: R38.1 U4.6(VOUTN)

### Library data of the parts
C14 = CAPACITOR_1206: MLCC capacitor in 1206 package
C15-C24 = CAPACITOR_0805: MLCC capacitor in 0805 package
D4 = STTH1R06A: as D1 on sheet Main_branch
D5 D6 = SS14: as D2 on sheet Main_branch; SnapEDA_Link: https://www.snapeda.com/parts/SS14/taiwan/view-part/?ref=snap; Package: SMA-2 Taiwan Semiconductor; MP: SS14; Check_prices: https://www.snapeda.com/parts/SS14/taiwan/view-part/?ref=eda
D13 = LTST-C171KRKT: as D12 on sheet Main_branch
PS2 = TBA 1-1211E: Converter: DC/DC; 1W; Uin: 10.8÷13.2VDC; Uout: 5VDC; Iout: 200mA; pin to pad: 3>4 4>6
Q3 Q4 = WMK36N65C4: as Q1 on sheet Main_branch; ManufacturerPartNumber: WMK36N65C4; PackageReference: PG-TO220
R20 R84 = RESISTOR_1206: SMD resistor in 1206 package
R21-R24 R26 R27 R32-R38 R83 = RESISTOR_0805: SMD resistor in 0805 package
  R26: Value: 100R
R25 R28 R29 = MAR251203FR030S: as R6 on sheet Main_branch; Value: 30mR; ComponentLink1Description: TME; ComponentLink1URL: https://www.tme.eu/pl/details/mar251203fr010s/rezystory-smd/wayon/; Power: 3W; Tolerance: 1%
R30 R31 = RESISTOR_0805: as R11 on sheet Main_branch
U3 = UCC21520ADW: as U1 on sheet Main_branch; SnapEDA_Link: https://www.snapeda.com/parts/UCC21520ADW/Texas+Instruments/view-part/?ref=snap; Package: SOIC-16 Texas Instruments; Value: *; MP: UCC21520ADW; Check_prices: https://www.snapeda.com/parts/UCC21520ADW/Texas+Instruments/view-part/?ref=eda
U4 = AMC1200: as U2 on sheet Main_branch

## Nets that join several sheets
+3V3A: Top (J5.9), Main_branch (C8.2 U2.8), DC_link_control (C50.2 C51.2 U9.8), Aux_branch (C34.2 U6.8), Active_N_branch (C21.2 U4.8)
+5V: Top (J2.1), Main_branch (C2.1 R4.2 U1.3 U1.8), DC_link_control (R61.2 R69.2), Aux_branch (C28.1 R42.2 U5.3 U5.8), Input (C47.2 PS5.4 TP20.1), Active_N_branch (C15.1 R23.2 U3.3 U3.8)
+12V: Main_branch (C3.2 PS1.1 R1.1 U1.11), DC_link_control (6 pins), Aux_branch (C29.2 PS3.1 R39.1 U5.11), Input (C46.2 PS4.+V TP19.1), Active_N_branch (C16.2 PS2.1 R20.1 U3.11)
+VDC: Top (J1.1 J3.1), Main_branch (Q1.2), DC_link_control (R76.2), Aux_branch (Q5.2), Input (7 pins), Active_N_branch (Q3.2)
-VDC: Top (J1.2), Main_branch (5 pins), DC_link_control (14 pins), Aux_branch (5 pins), Input (10 pins), Active_N_branch (5 pins)
GND: Top (7 pins), Main_branch (10 pins), DC_link_control (7 pins), Aux_branch (10 pins), Input (C47.1 PS5.3 TP21.1), Active_N_branch (10 pins)
+COIL: DC_link_control (D11.2 Q10.3), Input (RELAY1.A1)
+ISENSE_AUX: Top (J5.3), Aux_branch (C37.2 R55.2)
+ISENSE_MAIN: Top (J5.1), Main_branch (C11.2 R17.2)
+ISENSE_N: Top (J5.5), Active_N_branch (C24.2 R36.2)
+VSENSE: Top (J5.7), DC_link_control (C53.2 R72.2)
-ISENSE_AUX: Top (J5.4), Aux_branch (C37.1 R57.2)
-ISENSE_MAIN: Top (J5.2), Main_branch (C11.1 R19.2)
-ISENSE_N: Top (J5.6), Active_N_branch (C24.1 R38.2)
-VSENSE: Top (J5.8), DC_link_control (C53.1 R74.2)
AC_N: Top (J4.2), Input (5 pins)
BRAKE: Top (J7.11), DC_link_control (R64.1 TP22.1)
DISABLE: Top (J7.14), Main_branch (C6.2 R11.2 U1.5), Aux_branch (C32.2 R49.2 U5.5), Active_N_branch (C20.2 R30.2 U3.5)
INA_AUX: Top (J7.8), Aux_branch (R45.1 TP15.1)
INA_MAIN: Top (J7.12), Main_branch (R7.1 TP3.1)
INA_N: Top (J7.4), Active_N_branch (R26.1 TP9.1)
INB_AUX: Top (J7.6), Aux_branch (R46.1 TP16.1)
INB_MAIN: Top (J7.10), Main_branch (R8.1 TP4.1)
INB_N: Top (J7.2), Active_N_branch (R27.1 TP10.1)
NetF1_1: Top (J4.1), Input (F1.1)
NetJ3_2: Top (J3.2), DC_link_control (Q9.2)
OUT_AUX: Top (J6.2), Aux_branch (R44.2 R47.2 R48.2 R56.1)
OUT_MAIN: Top (J6.1), Main_branch (R6.2 R9.2 R10.2 R18.1)
OUT_N: Top (J6.3), Active_N_branch (R25.2 R28.2 R29.2 R37.1)
PRECHARGE: Top (J7.13), DC_link_control (R73.1 TP23.1)